# Altium project Button-Board_v2.0.PrjPcb (part 1 of 2)
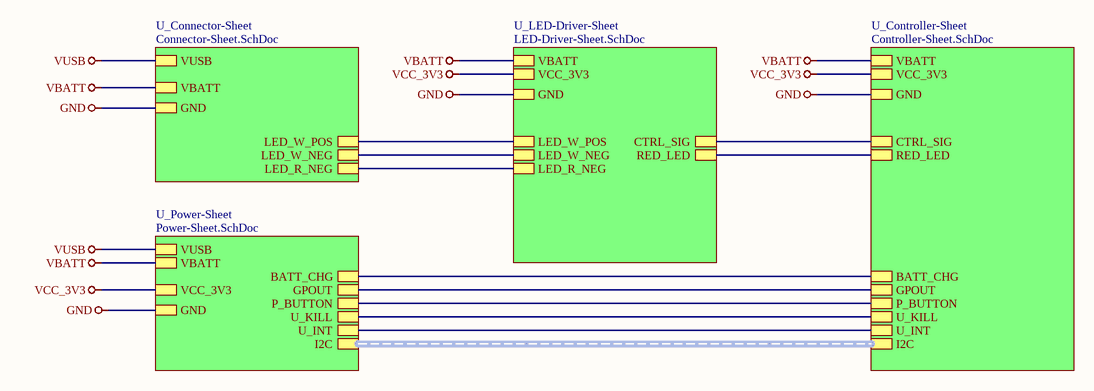
[diagram p0: Top-Sheet.SchDoc]
5 sheets, 55 parts. Net scope: hierarchical (ports join the sheet entries above them; power ports are global).
Board file: PCB_Button_Board_v2.0.PcbDoc
Sheets:
  Top-Sheet.SchDoc
    U_Connector-Sheet = Connector-Sheet.SchDoc
    U_Controller-Sheet = Controller-Sheet.SchDoc
    U_LED-Driver-Sheet = LED-Driver-Sheet.SchDoc
    U_Power-Sheet = Power-Sheet.SchDoc

## Sheet Top-Sheet.SchDoc
size A; DocumentNumber: 1; SheetNumber: 1; SheetTotal: 5

### Sub-sheets
U_Connector-Sheet = Connector-Sheet.SchDoc: VUSB, LED_W_POS, LED_W_NEG, LED_R_NEG, GND, VBATT
U_Controller-Sheet = Controller-Sheet.SchDoc: GND, VCC_3V3, RED_LED, CTRL_SIG, P_BUTTON, I2C (harness I2C), GPOUT, VBATT, U_KILL, U_INT, BATT_CHG
U_LED-Driver-Sheet = LED-Driver-Sheet.SchDoc: GND, VCC_3V3, RED_LED, CTRL_SIG, VBATT, LED_W_POS, LED_W_NEG, LED_R_NEG
U_Power-Sheet = Power-Sheet.SchDoc: GND, VCC_3V3, VUSB, VBATT, I2C (harness I2C), GPOUT, P_BUTTON, U_KILL, U_INT, BATT_CHG

### Nets
GND: sheet U_Connector-Sheet/GND, sheet U_Controller-Sheet/GND, sheet U_LED-Driver-Sheet/GND, sheet U_Power-Sheet/GND
VBATT: sheet U_Connector-Sheet/VBATT, sheet U_Controller-Sheet/VBATT, sheet U_LED-Driver-Sheet/VBATT, sheet U_Power-Sheet/VBATT
VCC_3V3: sheet U_Controller-Sheet/VCC_3V3, sheet U_LED-Driver-Sheet/VCC_3V3, sheet U_Power-Sheet/VCC_3V3
VUSB: sheet U_Connector-Sheet/VUSB, sheet U_Power-Sheet/VUSB
BATT_CHG: sheet U_Controller-Sheet/BATT_CHG, sheet U_Power-Sheet/BATT_CHG
CTRL_SIG: sheet U_Controller-Sheet/CTRL_SIG, sheet U_LED-Driver-Sheet/CTRL_SIG
GPOUT: sheet U_Controller-Sheet/GPOUT, sheet U_Power-Sheet/GPOUT
LED_R_NEG: sheet U_Connector-Sheet/LED_R_NEG, sheet U_LED-Driver-Sheet/LED_R_NEG
LED_W_NEG: sheet U_Connector-Sheet/LED_W_NEG, sheet U_LED-Driver-Sheet/LED_W_NEG
LED_W_POS: sheet U_Connector-Sheet/LED_W_POS, sheet U_LED-Driver-Sheet/LED_W_POS
P_BUTTON: sheet U_Controller-Sheet/P_BUTTON, sheet U_Power-Sheet/P_BUTTON
RED_LED: sheet U_Controller-Sheet/RED_LED, sheet U_LED-Driver-Sheet/RED_LED
U_INT: sheet U_Controller-Sheet/U_INT, sheet U_Power-Sheet/U_INT
U_KILL: sheet U_Controller-Sheet/U_KILL, sheet U_Power-Sheet/U_KILL

### Buses and harness runs
harness sheet U_Controller-Sheet/I2C = sheet U_Power-Sheet/I2C

## Sheet Connector-Sheet.SchDoc
size A4; DocumentNumber: 5; SheetNumber: 5; SheetTotal: 5
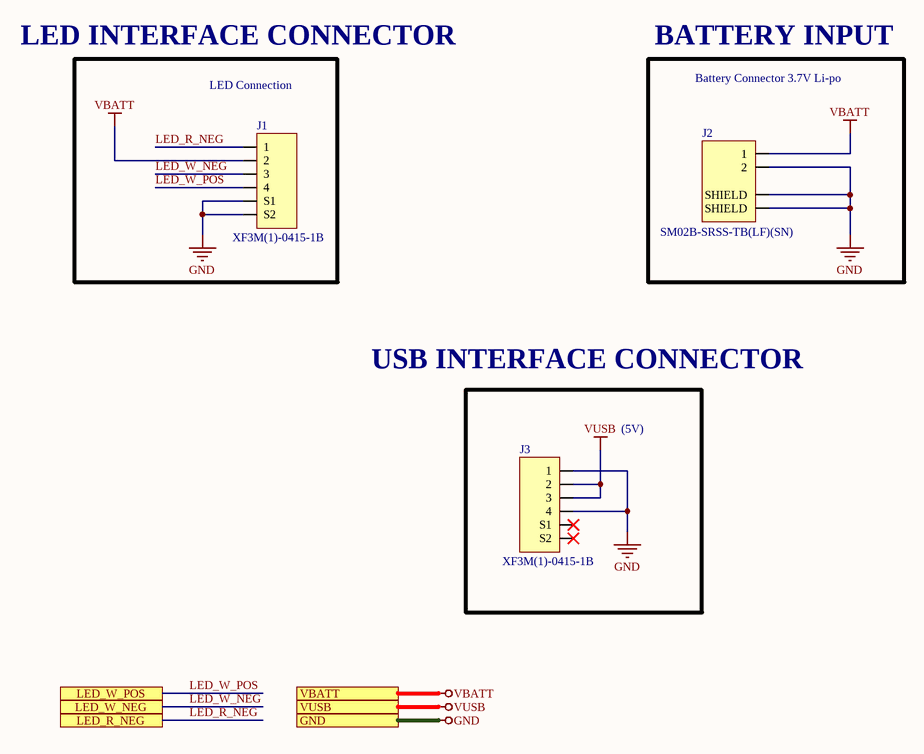
[diagram p1: Connector-Sheet.SchDoc]

### Parts
J1  XF3M(1)-0415-1B  [XF3M(1)-0415-1B]
J2  SM02B-SRSS-TB(LF)(SN)  [SM02B-SRSS-TB(LF)(SN)]
J3  XF3M(1)-0415-1B  [XF3M(1)-0415-1B]

### Blocks framed on the sheet
LED Connection: J1
BATTERY INPUT: J2
(5V): J3

### Ports
GND (see Top-Sheet[1B], Controller-Sheet[2D], LED-Driver-Sheet[2D], Power-Sheet[4C]), LED_R_NEG (see Top-Sheet[2B], LED-Driver-Sheet[1D]), LED_W_NEG (see Top-Sheet[2B], LED-Driver-Sheet[1D]), LED_W_POS (see Top-Sheet[2B], LED-Driver-Sheet[1D]), VBATT (see Top-Sheet[1A], Controller-Sheet[2D], LED-Driver-Sheet[2D], Power-Sheet[4C]), VUSB (see Top-Sheet[1A], Power-Sheet[4C])

### Nets
GND: J2.2 J2.3(SHIELD) J2.4(SHIELD) J3.1 J3.4 ; port GND
VBATT: J1.2 J2.1 ; port VBATT
VUSB: J3.2 J3.3 ; port VUSB
LED_R_NEG: J1.1 ; port LED_R_NEG
LED_W_NEG: J1.3 ; port LED_W_NEG
LED_W_POS: J1.4 ; port LED_W_POS

Not connected (* = marked no-connect by the designer): J1 S1 S2; J3 S1* S2*

### Notes on the sheet
- LED INTERFACE CONNECTOR
- Battery Connector 3.7V Li-po
- USB INTERFACE CONNECTOR
- File:
- Title:
- Date:
- Page
- Num:
- Total:
- Drawn By: Huzaifa Ali

### Library data of the parts
J1 J3 = XF3M(1)-0415-1B: 4 Position FFC, FPC Connector Contacts, Top and Bottom 0.039" (1.00mm) Surface Mount, Right Angle; Manufacturer: Omron Electronics Inc-EMC Div; Item Type: FPC-1mm; Manufacturer Part Number: XF3M(1)-0415-1B; Digikey Part Number: OR1210CT-ND; ComponentLink1Description: Digikey Link; ComponentLink1URL: https://www.digikey.com/en/products/detail/omron-electronics-inc-emc-div/XF3M-1-0415-1B/4695932; Package: 1mm FPC
J2 = SM02B-SRSS-TB(LF)(SN): Connector Header Surface Mount, Right Angle 2 position 0.039 _1.00mm_; Manufacturer Part NUmber: SM02B-SRSS-TB_LF__SN_; Manufacturer: JST Sales; SnapEDA_Link: https://www.snapeda.com/parts/SM02B-SRSS-TB%28LF%29%28SN%29/JST%20Sales%20America%20Inc./view-part/447499/?ref=snap; Price: None; Value: *; Availability: Unavailable; Package: None; Digikey Part Number: 455-SM02B-SRSS-TBDKR-ND; ComponentLink1Description: Digikey Link; ComponentLink1URL: https://www.digikey.com/en/products/detail/jst-sales-america-inc/SM02B-SRSS-TB/926708?s=N4IgTCBcDaIMoFkAMYBCBaOAlOd0BVUQBdAXyA

## Sheet Controller-Sheet.SchDoc
size A4; DocumentNumber: 3; SheetNumber: 3; SheetTotal: 5
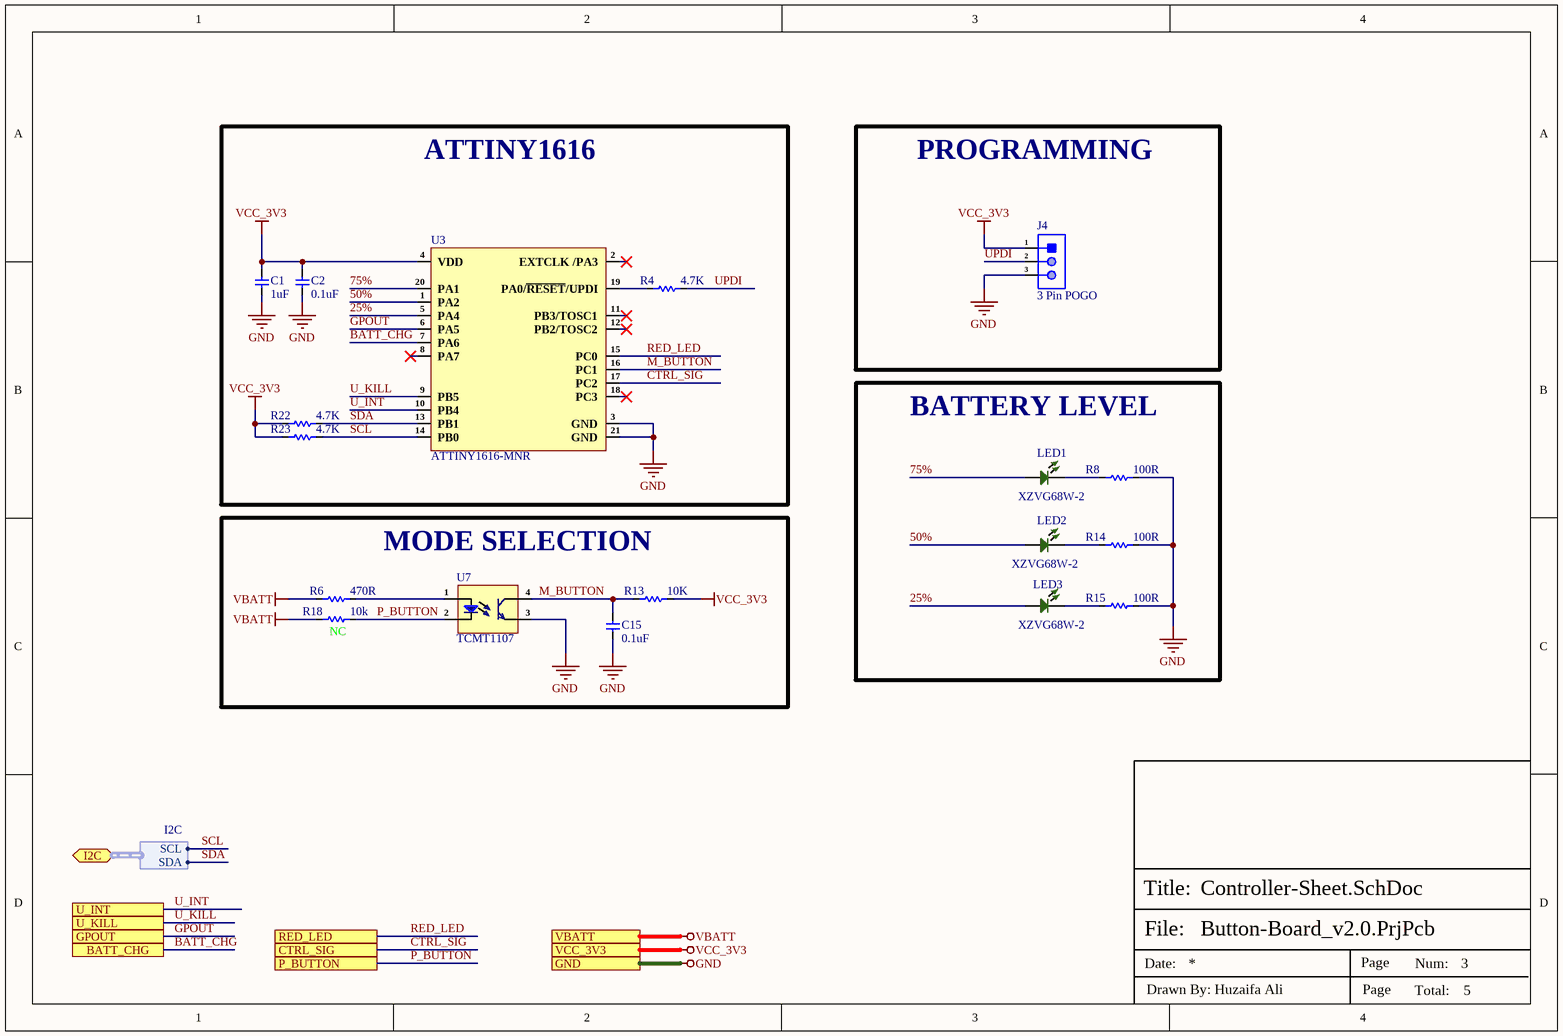
[diagram p2: Controller-Sheet.SchDoc]

### Parts
C1  1uF  [Cap-0402]
C2  0.1uF  [Cap-0402]
C15  0.1uF  [Cap-0402]
J4  3 Pin POGO  [3 Pin POGO]
LED1  XZVG68W-2  [LED-0402]
LED2  XZVG68W-2  [LED-0402]
LED3  XZVG68W-2  [LED-0402]
R4  4.7K  [Res-0402]
R6  470R  [Res-0402]
R8  100R  [Res-0402]
R13  10K  [Res-0402]
R14  100R  [Res-0402]
R15  100R  [Res-0402]
R18  NC  [Res-0402]
R22  4.7K  [Res-0201]
R23  4.7K  [Res-0201]
U3  ATTINY1616-MNR  [20-VQFN (3x3)]
U7  TCMT1107  [SOP-4-1.27mm pitch Body 2.6mm]

### Blocks framed on the sheet
ATTINY1616: C1 C2 R4 R22 R23 U3
PROGRAMMING: J4
BATTERY LEVEL: LED1-LED3 R8 R14 R15
MODE SELECTION: C15 R6 R13 R18 U7

### Ports
BATT_CHG (see Top-Sheet[3B], Power-Sheet[4C]), CTRL_SIG (see Top-Sheet[3B], LED-Driver-Sheet[1D]), GND (see Top-Sheet[3A], Connector-Sheet[2D], LED-Driver-Sheet[2D], Power-Sheet[4C]), GPOUT (see Top-Sheet[3B], Power-Sheet[4C]), I2C (bidir, harness I2C, see Top-Sheet[3B], Power-Sheet[4C]), P_BUTTON (see Top-Sheet[3B], Power-Sheet[4C]), RED_LED (see Top-Sheet[3B], LED-Driver-Sheet[1D]), U_INT (see Top-Sheet[3B], Power-Sheet[4C]), U_KILL (see Top-Sheet[3B], Power-Sheet[4C]), VBATT (see Top-Sheet[3A], Connector-Sheet[2D], LED-Driver-Sheet[2D], Power-Sheet[4C]), VCC_3V3 (see Top-Sheet[3A], LED-Driver-Sheet[2D], Power-Sheet[4C])

### Harnesses
I2C: SDA, SCL

### Nets
GND: C1.1 C2.1 C15.1 J4.3 R8.2 R14.2 R15.2 U3.3(GND) U3.21(GND) U7.3(E) ; port GND
VBATT: R6.1 R18.1 ; port VBATT
VCC_3V3: C1.2 C2.2 J4.1 R13.2 R22.1 R23.1 U3.4(VDD) ; port VCC_3V3
25%: LED3.1 U3.5(PA4)
50%: LED2.1 U3.1(PA2)
75%: LED1.1 U3.20(PA1)
BATT_CHG: U3.7(PA6) ; port BATT_CHG
CTRL_SIG: U3.17(PC2) ; port CTRL_SIG
GPOUT: U3.6(PA5) ; port GPOUT
M_BUTTON: C15.2 R13.1 U3.16(PC1) U7.4(C)
P_BUTTON: R18.2 U7.2(Ca) ; port P_BUTTON
RED_LED: U3.15(PC0) ; port RED_LED
SCL: R23.2 U3.14(PB0) ; port I2C.SCL
SDA: R22.2 U3.13(PB1) ; port I2C.SDA
U_INT: U3.10(PB4) ; port U_INT
U_KILL: U3.9(PB5) ; port U_KILL
UPDI: J4.2 R4.2
NetLED1_2: LED1.2 R8.1
NetLED2_2: LED2.2 R14.1
NetLED3_2: LED3.2 R15.1
NetR4_1: R4.1 U3.19(PA0/~{RESET}/UPDI)
NetR6_2: R6.2 U7.1(An)

Not connected (* = marked no-connect by the designer): U3 2(EXTCLK_/PA3)* 8(PA7)* 11(PB3/TOSC1)* 12(PB2/TOSC2)* 18(PC3)*

### Notes on the sheet
- (near R18) 10k
- File:
- Title:
- Date:
- Page
- Num:
- Total:
- Drawn By: Huzaifa Ali

### Library data of the parts
C1 = GRM033R60J105MEA2D: 1 µF ±20% 6.3V Ceramic Capacitor X5R 0201 (0603 Metric); Manufacturer: Murata Electronics; Manufacturer Part Number: GRM033R60J105MEA2D; Digikey Part Number: 490-7229-6-ND; Item Type: Capacitor; Package: 0201; ComponentLink1Description: Digikey Link; ComponentLink1URL: https://www.digikey.com/en/products/detail/murata-electronics/GRM033R60J105MEA2D/4213369
C2 = GRM155R71C104KA88J: 0.1 µF ±10% 16V Ceramic Capacitor X7R 0402 (1005 Metric); Manufacturer: Murata Electronics; Manufacturer Part Number: GRM155R71C104KA88J; Digikey Part Number: 490-6328-6-ND; Item Type: Capacitor; Package: 0402; ComponentLink1Description: Digikey Link; ComponentLink1URL: https://www.digikey.com/en/products/detail/murata-electronics/GRM155R71C104KA88J/2610892
C15 = GRM155R71C104KA88D: CAP CER 0.1UF 16V X7R 0402; Manufacturer: Murata; Material: Ceramic; Value: 100nF; Tolerance: 10%; Insulation Resistance: 10GR; Item Type: Capacitor; Supplier 1: Arrow Electronics; Manufacturer Part Number: GRM155R71C104KA88D; RoHS: Yes; Category: Ceramic Capacitors; Stock 1: 1690322; Pricing 1: 10000=0.00480, 30000=0.00470, 100000=0.00350, 250000=0.00330 (USD); Mounting Technology: Surface Mount; Case/Package: 0402; Pins: 2; Case Code (Metric): 1005; Case Code (Imperial): 0402; Dielectric Material: Ceramic; Min Operating Temperature: -55°C; Max Operating Temperature: 125°C; Voltage Rating: 16V; Packaging: Tape and Reel; Voltage Rating (DC): 16V; Package Quantity: 1; Dielectric: X7R; Termination: SMD/SMT; Voltage: 16V; Series: GRM; Length: 1mm; Width: 0.02inch; Height: 0.5mm; Thickness: 0.022inch; Depth: 0.5mm; Radiation Hardening: No; Lead Free: Lead Free; RoHS Compliant: Yes; ComponentLink1URL: https://datasheet.ciiva.com/129/grm155r71c104ka88-01-129739.pdf?src-supplier=Digi-Key; ComponentLink1Description: https://datasheet.ciiva.com/129/grm155r71c104ka88-01-129739.pdf?src-supplier=Digi-Key; ComponentLink2URL: https://datasheet.ciiva.com/129/grm155r71c104ka88-01-129740.pdf?src-supplier=Digi-Key; ComponentLink2Description: https://datasheet.ciiva.com/129/grm155r71c104ka88-01-129740.pdf?src-supplier=Digi-Key; ComponentLink3URL: https://datasheet.ciiva.com/18102/getdatasheetpartid-85307-18102905.pdf?src-supplier=Verical; ComponentLink3Description: https://datasheet.ciiva.com/18102/getdatasheetpartid-85307-18102905.pdf?src-supplier=Verical; ComponentLink4URL: https://datasheet.ciiva.com/29199/454098-da-01-en-vs-kondensator-0402-29199799.pdf?src-supplier=Conrad; ComponentLink4Description: https://datasheet.ciiva.com/29199/454098-da-01-en-vs-kondensator-0402-29199799.pdf?src-supplier=Conrad; ComponentLink5URL: https://datasheet.ciiva.com/7937/4360-7937615.pdf?src-supplier=Element14; ComponentLink5Description: https://datasheet.ciiva.com/7937/4360-7937615.pdf?src-supplier=Element14; ComponentLink6URL: https://datasheet.ciiva.com/14116/grmseries-highdielectrictype-eng-14116878.pdf?src-supplier=Distrelec; ComponentLink6Description: https://datasheet.ciiva.com/14116/grmseries-highdielectrictype-eng-14116878.pdf?src-supplier=Distrelec; ComponentLink7URL: https://datasheet.ciiva.com/14103/grmseries-highdielectrictype-eng-14103750.pdf?src-supplier=Distrelec; ComponentLink7Description: https://datasheet.ciiva.com/14103/grmseries-highdielectrictype-eng-14103750.pdf?src-supplier=Distrelec; ComponentLink8URL: https://datasheet.ciiva.com/28534/4360-28534127.pdf?src-supplier=Element14; ComponentLink8Description: https://datasheet.ciiva.com/28534/4360-28534127.pdf?src-supplier=Element14; ComponentLink9URL: https://datasheet.ciiva.com/28534/4360-28534133.pdf?src-supplier=Element14; ComponentLink9Description: https://datasheet.ciiva.com/28534/4360-28534133.pdf?src-supplier=Element14; ComponentLink10URL: https://datasheet.ciiva.com/16199/product-16199000.pdf?src-supplier=Future+Electronics; ComponentLink10Description: https://datasheet.ciiva.com/16199/product-16199000.pdf?src-supplier=Future+Electronics; Supplier Part Number 1: GRM155R71C104KA88D; LCSC Part Number: C71629
J4 = 68000-103HLF: CONN HEADER VERT 3POS 2.54MM; Item Type: Male Header; Number of Positions: 3; Current Rating: 3A; Insulation Resistance: 5GR; Voltage Rating: 1.5kV; Contact Post Length: 2.41mm; LCSC Part Number: C168677; ComponentLink1Description: LCSC; Supplier: Avnet; Supplier Part Number: 88K1775; RoHS: No; Category: Headers and Wire Housings; Stock: 2805; Pricing: 1=0.395, 10=0.31, 25=0.29, 50=0.27, 100=0.25 (USD); Contact Plating: Gold,GXT; Contact Material: Bronze; Housing Material: Thermoplastic; Housing Color: Black; Min Operating Temperature: -65°C; Max Operating Temperature: 125°C; Number of Rows: 1; Termination: Through Hole; Packaging: Bulk; Number of Contacts: 3; Contact Gender: Male; Orientation: Straight; Max Voltage Rating (AC): 1.5kV; Package Quantity: 100; Series: 68000; Length: 7.62mm; Pitch: 2.54mm; Contact Mating Length: 5.84mm; Depth: 2.41mm; Radiation Hardening: No; Flammability Rating: UL94 V-0; Reach SVHC Compliant: No; ComponentLink2URL: https://datasheet.ciiva.com/46392/1914865-46392021.pdf?src-supplier=Element14; ComponentLink2Description: https://datasheet.ciiva.com/46392/1914865-46392021.pdf?src-supplier=Element14; Digikey Part Number: 609-3461-ND; ComponentLink3Description: Digikey Link; ComponentLink3URL: https://www.digikey.com/en/products/detail/amphenol-cs-fci/68000-103HLF/2023309?s=N4IgTCBcDaIGwA4AMKC0BGJBmAEgGQDEQBdAXyA; Manufacturer Part Number: 68000-103HLF
LED1-LED3 = XZVG68W-2: LED GREEN CLEAR CHIP SMD; Manufacturer: SunLED; Lens Color: Colorless; Luminous Intensity: 49mcd; Test Current: 20mA; Viewing Angle: 120°; Dominant Wavelength: 570nm; Forward Voltage: 2.1V; Supplier 1: Digi-Key; Manufacturer Part Number: XZVG68W-2; Stock 1: 4185; Pricing 1: 1=0.5, 10=0.36, 100=0.16, 500=0.112, 1000=0.092 (USD); Mount: Surface Mount; Case/Package: 0402; Color: Green; Case Code (Metric): 1005; Case Code (Imperial): 0402; Packaging: Tape and Reel; Lens Transparency: Clear; Length: 1mm; Height: 0.6mm; Width: 0.5mm; ComponentLink1URL: http://www.sunledusa.com/products/spec/XZVG68W-2.pdf?src-supplier=Digi-Key; ComponentLink1Description: http://www.sunledusa.com/products/spec/XZVG68W-2.pdf?src-supplier=Digi-Key; ComponentLink2URL: https://www.sunledusa.com/products/spec/XZVG68W-2.pdf?src-supplier=Digi-Key; ComponentLink2Description: https://www.sunledusa.com/products/spec/XZVG68W-2.pdf?src-supplier=Digi-Key; Supplier Part Number 1: 1497-1219-6-ND; Item Type: LED
R4 = RC0402FR-074K7L: 4.7 kOhms ±1% 0.063W, 1/16W Chip Resistor 0402 (1005 Metric) Moisture Resistant Thick Film; Manufacturer: YAGEO; Manufacturer Part Number: RC0402FR-074K7L; Digikey Part Number: 311-4.7KLRDKR-ND; Item Type: Resistor; Package: 0402; ComponentLink1Description: Digikey Link; ComponentLink1URL: https://www.digikey.com/en/products/detail/yageo/RC0402FR-074K7L/2827563
R6 = RC0402FR-07470RL: RES 470 OHM 1% 1/16W 0402; Manufacturer: Yageo; Item Type: Resistor; Voltage Rating: 50V; Power Rating: 62.5mW; Temperature Coefficient: 100ppm/°C; Max Power Dissipation: 63mW; Supplier: Avnet; Supplier Part Number: RC0402FR-07470RL; Manufacturer Part Number: RC0402FR-07470RL; RoHS: Yes; Stock: 10000; Pricing: 10000=0.00085 (USD); Case/Package: 0402; Case Code (Metric): 1005; Case Code (Imperial): 0402; Min Operating Temperature: -55°C; Max Operating Temperature: 155°C; Packaging: Tape and Reel; Value: 470R; Tolerance: 1%; Number of Terminations: 2; Working Voltage: 50V; Package Quantity: 1; Resistor Type: Thick Film; Termination: SMD/SMT; Features: Moisture Resistant; Series: RC; Resistance Tolerance: 1%; Construction: Rectangular; Voltage Rating (AC): 50V; Length: 1mm; Width: 0.02inch; Height: 0.016inch; Depth: 0.5mm; Lead Free: Lead Free; Reach SVHC Compliant: No; RoHS Compliant: Yes; Military Standard: Not; ComponentLink1URL: https://datasheet.ciiva.com/46412/1018594-46412838.pdf?src-supplier=Element14; ComponentLink1Description: https://datasheet.ciiva.com/46412/1018594-46412838.pdf?src-supplier=Element14; ComponentLink2URL: https://datasheet.ciiva.com/2453/pyu-r-int-thick-7-2453377.pdf?src-supplier=Digikey; ComponentLink2Description: https://datasheet.ciiva.com/2453/pyu-r-int-thick-7-2453377.pdf?src-supplier=Digikey; ComponentLink3URL: https://datasheet.ciiva.com/2453/pyu-r-int-thick-7-2453378.pdf?src-supplier=Digikey; ComponentLink3Description: https://datasheet.ciiva.com/2453/pyu-r-int-thick-7-2453378.pdf?src-supplier=Digikey; ComponentLink4URL: https://datasheet.ciiva.com/2453/pyu-r-int-thick-7-2453376.pdf?src-supplier=Digikey; ComponentLink4Description: https://datasheet.ciiva.com/2453/pyu-r-int-thick-7-2453376.pdf?src-supplier=Digikey; ComponentLink5URL: https://datasheet.ciiva.com/7850/1018594-7850015.pdf?src-supplier=Element14; ComponentLink5Description: https://datasheet.ciiva.com/7850/1018594-7850015.pdf?src-supplier=Element14; ComponentLink6URL: https://datasheet.ciiva.com/7850/1018594-7850014.pdf?src-supplier=Element14; ComponentLink6Description: https://datasheet.ciiva.com/7850/1018594-7850014.pdf?src-supplier=Element14; ComponentLink7URL: https://datasheet.ciiva.com/15189/getdatasheetpartid-330246-15189463.pdf?src-supplier=Verical; ComponentLink7Description: https://datasheet.ciiva.com/15189/getdatasheetpartid-330246-15189463.pdf?src-supplier=Verical; LCSC Part Number: C114877
R8 R14 R15 = RC0402FR-07100RL: 100 Ohms ±1% 0.063W, 1/16W Chip Resistor 0402 (1005 Metric) Moisture Resistant Thick Film; Manufacturer: YAGEO; Manufacturer Part Number: RC0402FR-07100RL; Digikey Part Number: 311-100LRDKR-ND; Item Type: Resistor; Package: 0402; ComponentLink1Description: Digikey Link; ComponentLink1URL: https://www.digikey.com/en/products/detail/yageo/RC0402FR-07100RL/726527
R13 = RC0402FR-0710KL: RES 10K OHM 1% 1/16W 0402; Manufacturer: Yageo; Resistance: 10kR; Voltage Rating (DC): 50V; Temperature Coefficient: 100ppm/°C; Power Rating: 62.5mW; Max Power Dissipation: 63mW; Item Type: Resistor; Supplier 1: Mouser; Manufacturer Part Number: RC0402FR-0710KL; RoHS: Yes; Category: Chip SMD Resistors; Stock 1: 18648329; Pricing 1: 1=0.10000, 10=0.01400, 50=0.01400, 100=0.00500, 1000=0.00300, 10000=0.00200 (USD); Case/Package: 0402; Number of Pins: 2; Case Code (Imperial): 0402; Case Code (Metric): 1005; Min Operating Temperature: -55°C; Max Operating Temperature: 155°C; Resistor Type: Thick Film; Tolerance: 1%; Packaging: Tape and Reel; Voltage Rating: 50V; Termination: SMD/SMT; Working Voltage: 50V; Number of Terminations: 2; Features: Moisture Resistant; Series: RC; Resistance Tolerance: 1%; Construction: Rectangular; Length: 1mm; Width: 0.5mm; Height: 0.32mm; Depth: 0.5mm; Lead Pitch: 0.2mm; REACH SVHC: No SVHC; Lead Free: Lead Free; RoHS Compliant: Yes; Military Standard: Not; ComponentLink1URL: https://datasheet.ciiva.com/7660/38568-7660787.pdf?src-supplier=Element14; ComponentLink1Description: https://datasheet.ciiva.com/7660/38568-7660787.pdf?src-supplier=Element14; ComponentLink2URL: https://datasheet.ciiva.com/7849/1686128-7849814.pdf?src-supplier=Element14; ComponentLink2Description: https://datasheet.ciiva.com/7849/1686128-7849814.pdf?src-supplier=Element14; ComponentLink3URL: https://datasheet.ciiva.com/7983/1018594-7983486.pdf?src-supplier=Element14; ComponentLink3Description: https://datasheet.ciiva.com/7983/1018594-7983486.pdf?src-supplier=Element14; ComponentLink4URL: https://datasheet.ciiva.com/22747/1018594-22747512.pdf?src-supplier=Element14; ComponentLink4Description: https://datasheet.ciiva.com/22747/1018594-22747512.pdf?src-supplier=Element14; ComponentLink5URL: https://datasheet.ciiva.com/12667/pyu-rc0402-51-rohs-l-6-r-12667067.pdf?src-supplier=Mouser; ComponentLink5Description: https://datasheet.ciiva.com/12667/pyu-rc0402-51-rohs-l-6-r-12667067.pdf?src-supplier=Mouser; ComponentLink6URL: https://datasheet.ciiva.com/7849/1784430-7849813.pdf?src-supplier=Element14; ComponentLink6Description: https://datasheet.ciiva.com/7849/1784430-7849813.pdf?src-supplier=Element14; ComponentLink7URL: https://datasheet.ciiva.com/7849/1784430-7849815.pdf?src-supplier=Element14; ComponentLink7Description: https://datasheet.ciiva.com/7849/1784430-7849815.pdf?src-supplier=Element14; Supplier Part Number 1: 603-RC0402FR-0710KL; LCSC Part Number: C60490
R18 = RT0402BRD0710KL: RES SMD 10K OHM 0.1% 1/16W 0402; Manufacturer: Yageo; Item Type: Resistor; Supplier: Future Electronics; Supplier Part Number: 1236728; Manufacturer Part Number: RT0402BRD0710KL; RoHS: Yes; Category: Chip SMD Resistors; Stock: 490000; Pricing: 10000=0.0218, 20000=0.0213, 30000=0.021, 50000=0.0206, 100000=0.0199 (USD); ComponentLink1URL: https://datasheet.ciiva.com/12836/pyu-rt-1-to-0-05-rohs-l-4-12836454.pdf?src-supplier=Mouser; ComponentLink1Description: https://datasheet.ciiva.com/12836/pyu-rt-1-to-0-05-rohs-l-4-12836454.pdf?src-supplier=Mouser; LCSC Part Number: C190095
R22 R23 = RC0201FR-074K7L: RES 4.7K OHM 1% 1/20W 0201; Manufacturer: Yageo; Item Type: Resistor; Supplier: Future Electronics; Supplier Part Number: 7537285; Manufacturer Part Number: RC0201FR-074K7L; RoHS: Yes; Category: Chip SMD Resistors; Stock: 1610000; Pricing: 10000=0.0014, 50000=0.0013, 250000=0.0013, 750000=0.0012, 2000000=0.0011 (USD); ComponentLink1URL: https://datasheet.ciiva.com/2493/pyu-r-int-thick-7-2493811.pdf?src-supplier=Digi-Key; ComponentLink1Description: https://datasheet.ciiva.com/2493/pyu-r-int-thick-7-2493811.pdf?src-supplier=Digi-Key; ComponentLink2URL: https://datasheet.ciiva.com/2493/pyu-r-int-thick-7-2493812.pdf?src-supplier=Digi-Key; ComponentLink2Description: https://datasheet.ciiva.com/2493/pyu-r-int-thick-7-2493812.pdf?src-supplier=Digi-Key; ComponentLink3URL: https://datasheet.ciiva.com/2493/pyu-r-int-thick-7-2493813.pdf?src-supplier=Digi-Key; ComponentLink3Description: https://datasheet.ciiva.com/2493/pyu-r-int-thick-7-2493813.pdf?src-supplier=Digi-Key; ComponentLink4URL: https://datasheet.ciiva.com/8892/pyu-rc0201-51-rohs-l-8-8892942.pdf?src-supplier=Avnet; ComponentLink4Description: https://datasheet.ciiva.com/8892/pyu-rc0201-51-rohs-l-8-8892942.pdf?src-supplier=Avnet; ComponentLink5URL: https://datasheet.ciiva.com/7672/1563626-7672233.pdf?src-supplier=Element14; ComponentLink5Description: https://datasheet.ciiva.com/7672/1563626-7672233.pdf?src-supplier=Element14; LCSC Part Number: C138135
U3 = ATTINY1616-MNR: AVR tinyAVR™ 1, Functional Safety (FuSa) Microcontroller IC 8-Bit 20MHz 16KB (16K x 8) FLASH 20-VQFN (3x3); Manufacturer: Microchip Tech; Manufacturer Part Number: ATTINY1616-MNR; Package: QFN-20-EP(3x3); Digikey Part Number: ATTINY1616-MNRDKR-ND; Item Type: IC; ComponentLink1URL: https://www.digikey.com/en/products/detail/microchip-technology/ATTINY1616-MNR/7354618?s=N4IgTCBcDaIIIBUEEkByBNAjANhwWgFlUAlEAXQF8g; ComponentLink1Description: Digikey Link
U7 = TCMT1107: OPTOISOLATOR 3.75KV TRANS 4-SOP; Manufacturer: Vishay Semiconductors; Item Type: Optocouplers; Voltage Rating (DC): 70V; Turn-Off Delay Time: 4us; Turn-On Delay Time: 1.5us; Supplier: Mouser; LCSC Part Number: C81148; Manufacturer Part Number: TCMT1107; RoHS: Yes; Stock: 27846; Pricing: 1=0.6, 10=0.386, 50=0.386, 100=0.26, 1000=0.203, 10000=0.163 (USD); Height: 2.3mm; Lead Free: 5697LeadFree; RoHS Compliant: 5897YesNo; ComponentLink1URL: https://datasheet.ciiva.com/11772/0900766b80e30939-11772485.pdf?src-supplier=Rs; ComponentLink1Description: https://datasheet.ciiva.com/11772/0900766b80e30939-11772485.pdf?src-supplier=Rs; ComponentLink2URL: https://datasheet.ciiva.com/27051/1107109-27051440.pdf?src-supplier=Jameco; ComponentLink2Description: https://datasheet.ciiva.com/27051/1107109-27051440.pdf?src-supplier=Jameco; ComponentLink3URL: https://datasheet.ciiva.com/8040/485045-8040879.pdf?src-supplier=Element14; ComponentLink3Description: https://datasheet.ciiva.com/8040/485045-8040879.pdf?src-supplier=Element14; ComponentLink4URL: https://datasheet.ciiva.com/14079/tcmt1100-14079945.pdf?src-supplier=Digikey; ComponentLink4Description: https://datasheet.ciiva.com/14079/tcmt1100-14079945.pdf?src-supplier=Digikey; ComponentLink5URL: https://datasheet.ciiva.com/14079/tcmt1100-14079946.pdf?src-supplier=Digikey; ComponentLink5Description: https://datasheet.ciiva.com/14079/tcmt1100-14079946.pdf?src-supplier=Digikey; ComponentLink6URL: https://datasheet.ciiva.com/8092/tcmt1100-8092285.pdf?src-supplier=Avnet; ComponentLink6Description: https://datasheet.ciiva.com/8092/tcmt1100-8092285.pdf?src-supplier=Avnet; ComponentLink7URL: https://datasheet.ciiva.com/12088/tcmt1100-103040-12088638.pdf?src-supplier=Mouser; ComponentLink7Description: https://datasheet.ciiva.com/12088/tcmt1100-103040-12088638.pdf?src-supplier=Mouser

## Sheet LED-Driver-Sheet.SchDoc
size A4; DocumentNumber: 4; SheetNumber: 4; SheetTotal: 5
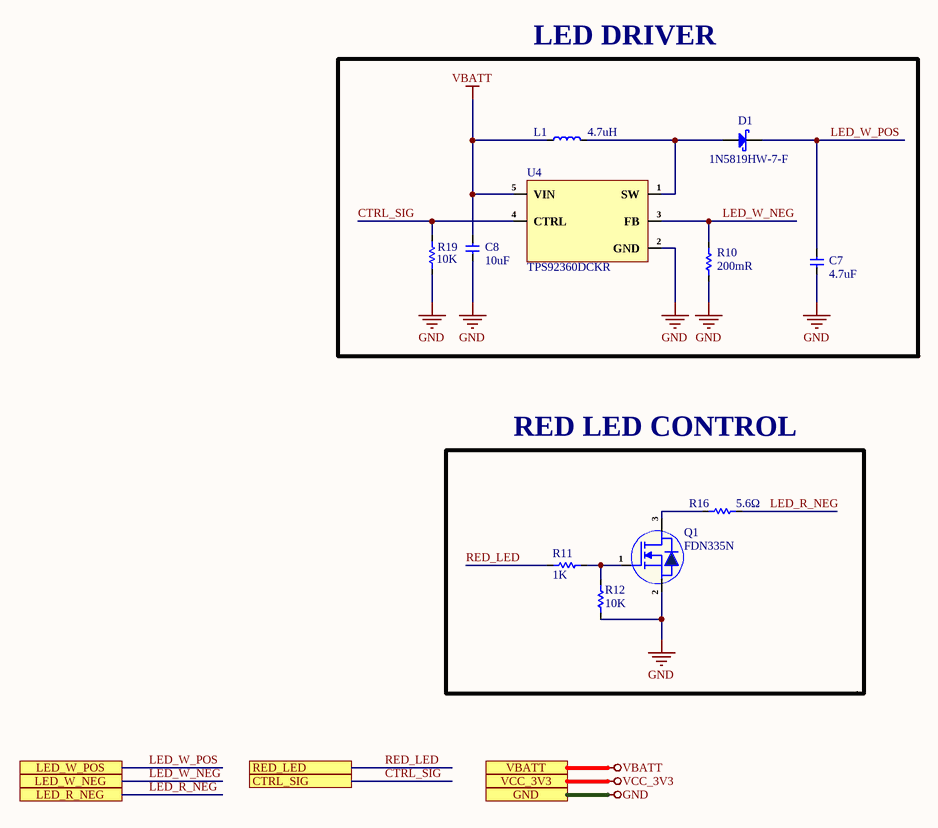
[diagram p3: LED-Driver-Sheet.SchDoc]

### Parts
C7  4.7uF  [Cap-0402]
C8  10uF  [Cap-0402]
D1  1N5819HW-7-F  [SOD-123]
L1  4.7uH  [IND-1210_]
Q1  FDN335N  [SOT-23]
R10  200mR  [Res-1206]
R11  1K  [Res-0402]
R12  10K  [Res-0402]
R16  5.6Ω  [Res-1206]
R19  10K  [Res-0402]
U4  TPS92360DCKR  [SC70-5]

### Blocks framed on the sheet
LED DRIVER: C7 C8 D1 L1 R10 R19 U4
RED LED CONTROL: Q1 R11 R12 R16

### Ports
CTRL_SIG (see Top-Sheet[3B], Controller-Sheet[1D]), GND (see Top-Sheet[2A], Connector-Sheet[2D], Controller-Sheet[2D], Power-Sheet[4C]), LED_R_NEG (see Top-Sheet[2B], Connector-Sheet[1D]), LED_W_NEG (see Top-Sheet[2B], Connector-Sheet[1D]), LED_W_POS (see Top-Sheet[2B], Connector-Sheet[1D]), RED_LED (see Top-Sheet[3B], Controller-Sheet[1D]), VBATT (see Top-Sheet[2A], Connector-Sheet[2D], Controller-Sheet[2D], Power-Sheet[4C]), VCC_3V3 (see Top-Sheet[2A], Controller-Sheet[2D], Power-Sheet[4C])

### Nets
GND: C7.1 C8.1 Q1.2(S) R10.1 R12.2 R19.1 U4.2(GND) ; port GND
VBATT: C8.2 L1.1 U4.5(VIN) ; port VBATT
CTRL_SIG: R19.2 U4.4(CTRL) ; port CTRL_SIG
LED_R_NEG: R16.2 ; port LED_R_NEG
LED_W_NEG: R10.2 U4.3(FB) ; port LED_W_NEG
LED_W_POS: C7.2 D1.2(K) ; port LED_W_POS
RED_LED: R11.1 ; port RED_LED
NetD1_1: D1.1(A) L1.2 U4.1(SW)
NetQ1_1: Q1.1(G) R11.2 R12.1
NetQ1_3: Q1.3(D) R16.1

### Notes on the sheet
- File:
- Title:
- Date:
- Page
- Num:
- Total:
- Drawn By: Huzaifa Ali

### Library data of the parts
C7 = CL05A475MO5NUNC: CAP CER 4.7UF 16V X5R 0402; Manufacturer: Samsung; Material: 4241ConductorMaterial; Tolerance: 20%; Supplier 1: Avnet; Manufacturer Part Number: CL05A475MO5NUNC; RoHS: Yes; Category: Ceramic Capacitors; Stock 1: 50000; Pricing 1: 10000=0.09712 (USD); Mount: Surface Mount; Case/Package: 0402; Case Code (Metric): 1005; Case Code (Imperial): 0402; Min Operating Temperature: -55°C; Max Operating Temperature: 85°C; Packaging: Cut Tape; Capacitance: 4.7uF; Voltage Rating: 16V; Series: CL; Voltage Rating (DC): 16V; Length: 0.039inch; Width: 0.02inch; Height: 550um; Thickness: 0.022inch; RoHS Compliant: Yes; ComponentLink1URL: http://www.farnell.com/datasheets/2710653.pdf?src-supplier=Farnell; ComponentLink1Description: http://www.farnell.com/datasheets/2710653.pdf?src-supplier=Farnell; ComponentLink2URL: http://www.samsungsem.com/kr/support/product-search/mlcc/CL05A475MO5NUNC.jsp?src-supplier=Digikey; ComponentLink2Description: http://www.samsungsem.com/kr/support/product-search/mlcc/CL05A475MO5NUNC.jsp?src-supplier=Digikey; ComponentLink3URL: http://www.farnell.com/datasheets/2710653.pdf?src-supplier=Element14; ComponentLink3Description: http://www.farnell.com/datasheets/2710653.pdf?src-supplier=Element14; ComponentLink4URL: https://datasheet.octopart.com/CL05A475MO5NUNC-Samsung-Electro-Mechanics-datasheet-123102911.pdf?src-supplier=Future+Electronics; ComponentLink4Description: https://datasheet.octopart.com/CL05A475MO5NUNC-Samsung-Electro-Mechanics-datasheet-123102911.pdf?src-supplier=Future+Electronics; ComponentLink5URL: http://www.farnell.com/datasheets/2710653.pdf?src-supplier=Newark; ComponentLink5Description: http://www.farnell.com/datasheets/2710653.pdf?src-supplier=Newark; Supplier Part Number 1: CL05A475MO5NUNC
C8 = CL05A106MP5NUNC: CAP CER 10UF 10V X5R 0402; Manufacturer: Samsung; Tolerance: 20%; Item Type: Capacitor; Supplier 1: Avnet; Manufacturer Part Number: CL05A106MP5NUNC; RoHS: Yes; Category: Ceramic Capacitors; Stock 1: 1729850; Pricing 1: 10000=0.02537 (USD); Mount: Surface Mount; Case/Package: 0402; Case Code (Metric): 1005; Case Code (Imperial): 0402; Contact Plating: Tin; Min Operating Temperature: -55°C; Max Operating Temperature: 85°C; Package Quantity: 1; Packaging: Tape and Reel; Capacitance: 10uF; Voltage Rating: 10V; Dielectric: X5R; Termination: Wraparound; Series: CL; Construction: Flat; Length: 1mm; Width: 0.02inch; Thickness: 0.028inch; Depth: 0.5mm; Radiation Hardening: No; Lead Free: Lead Free; RoHS Compliant: Yes; ComponentLink1URL: https://datasheet.ciiva.com/25721/cl05a106mp5nunc-25721584.pdf?src-supplier=Digi-Key; ComponentLink1Description: https://datasheet.ciiva.com/25721/cl05a106mp5nunc-25721584.pdf?src-supplier=Digi-Key; ComponentLink2URL: https://datasheet.ciiva.com/26838/getdatasheetpartid-745310-26838170.pdf?src-supplier=Verical; ComponentLink2Description: https://datasheet.ciiva.com/26838/getdatasheetpartid-745310-26838170.pdf?src-supplier=Verical; Supplier Part Number 1: CL05A106MP5NUNC; LCSC Part Number: C315248
D1 = 1N5819HW-7-F: DIODE SCHOTTKY 40V 1A SOD123; Manufacturer: Diodes; Forward Voltage: 450mV; Max Reverse Current: 50uA; Element Configuration: Single; Max Forward Surge Current (Ifsm): 25A; Max Power Dissipation: 450mW; Polarity: Standard; Capacitance: 110pF; Supplier 1: Digi-Key; Manufacturer Part Number: 1N5819HW-7-F; RoHS: Yes; Category: Schottky Diodes; Pricing 1: 1=0.46000, 10=0.34500, 100=0.19530, 500=0.12936, 1000=0.09918 (USD); Case/Package: SOD-123-2; Number of Pins: 2; Weight: 0.000353oz; Contact Plating: Tin,Matte; Min Operating Temperature: -65°C; Max Operating Temperature: 125°C; Forward Current: 1A; Max Repetitive Reverse Voltage (Vrrm): 40V; Packaging: Tape and Reel; Peak Non-Repetitive Surge Current: 25A; Package Quantity: 3000; Average Rectified Current: 1A; Termination: SMD/SMT; Voltage Rating (DC): 40V; Current Rating: 1A; Output Current: 1A; Max Reverse Voltage (DC): 40V; Series: -; Length: 2.85mm; Width: 1.7mm; Height: 1.25mm; Radiation Hardening: No; RoHS Compliant: Yes; REACH SVHC: No SVHC; Lead Free: Lead Free; ComponentLink1URL: https://datasheet.ciiva.com/16303/ds30217-16303296.pdf?src-supplier=Future+Electronics; ComponentLink1Description: https://datasheet.ciiva.com/16303/ds30217-16303296.pdf?src-supplier=Future+Electronics; ComponentLink2URL: https://datasheet.ciiva.com/27092/1538419-27092484.pdf?src-supplier=Jameco; ComponentLink2Description: https://datasheet.ciiva.com/27092/1538419-27092484.pdf?src-supplier=Jameco; ComponentLink3URL: https://datasheet.ciiva.com/912/ds30217-912801.pdf?src-supplier=Digi-Key; ComponentLink3Description: https://datasheet.ciiva.com/912/ds30217-912801.pdf?src-supplier=Digi-Key; ComponentLink4URL: https://datasheet.ciiva.com/1177/ds30217-1177089.pdf?src-supplier=Element14; ComponentLink4Description: https://datasheet.ciiva.com/1177/ds30217-1177089.pdf?src-supplier=Element14; ComponentLink5URL: https://datasheet.ciiva.com/912/ds30217-912802.pdf?src-supplier=Digi-Key; ComponentLink5Description: https://datasheet.ciiva.com/912/ds30217-912802.pdf?src-supplier=Digi-Key; ComponentLink6URL: https://datasheet.ciiva.com/912/ds30217-912803.pdf?src-supplier=Digi-Key; ComponentLink6Description: https://datasheet.ciiva.com/912/ds30217-912803.pdf?src-supplier=Digi-Key; ComponentLink7URL: https://datasheet.ciiva.com/8303/ds30217-8303132.pdf?src-supplier=Avnet; ComponentLink7Description: https://datasheet.ciiva.com/8303/ds30217-8303132.pdf?src-supplier=Avnet; ComponentLink8URL: https://datasheet.ciiva.com/25919/ds30217-25919644.pdf?src-supplier=Avnet+Europe; ComponentLink8Description: https://datasheet.ciiva.com/25919/ds30217-25919644.pdf?src-supplier=Avnet+Europe; Supplier Part Number 1: 1N5819HW-FDICT-ND; LCSC Part Number: C82544; Item Type: Diode
L1 = DFE322512F-4R7M=P2: FIXED IND 4.7UH 1.6A 157MOHM SMD; Manufacturer: Murata; Item Type: Inductor; Supplier 1: Digi-Key; Manufacturer Part Number: DFE322512F-4R7M=P2; RoHS: Yes; Category: Fixed Inductors; Stock 1: 4687; Pricing 1: 1=0.61, 10=0.533, 25=0.4952, 50=0.4188, 100=0.3808, 250=0.35792, 500=0.31984, 1000=0.25892 (USD); RoHS Compliant: Yes; Supplier Part Number 1: 490-DFE322512F-4R7M=P2CT-ND; LCSC Part Number: C703083
Q1 = FDN335N: SOT-23 MOSFETs ROHS; Manufacturer: onsemi; Item Type: Mosfet; Manufacturer Part Number: FDN335N; Package: SOT-23; Digikey Part Number: FDN335NDKR-ND; ComponentLink1Description: Digikey Link; ComponentLink1URL: https://www.digikey.com/en/products/detail/onsemi/FDN335N/965301
R10 = PE1206FRF470R2L: RES 0.2 OHM 1% 1W 1206; Manufacturer: Yageo; Item Type: Resistors; Temperature Coefficient: 100ppm/°C; Supplier: Digikey; LCSC Part Number: C723709; Manufacturer Part Number: PE1206FRF470R2L; RoHS: Yes; Stock: 7734; Pricing: 1=0.63, 10=0.459, 25=0.368, 50=0.2732, 100=0.1927, 250=0.17164, 500=0.14714, 1000=0.1121 (USD); Case/Package: 340Case; Packaging: 10Packaging; Value: 200mR; RoHS Compliant: Yes
R11 = RC0402FR-071KL: 1 kOhms ±1% 0.063W, 1/16W Chip Resistor 0402 (1005 Metric) Moisture Resistant Thick Film; Manufacturer: YAGEO; Manufacturer Part Number: RC0402FR-071KL; Digikey Part Number: 311-1.00KLRDKR-ND; Item Type: Resistor; Package: 0402; ComponentLink1Description: Digikey Link; ComponentLink1URL: https://www.digikey.com/en/products/detail/yageo/RC0402FR-071KL/726513
R12 = RC0603FR-0710KL: 10 kOhms ±1% 0.063W, 1/16W Chip Resistor 0402 (1005 Metric) Moisture Resistant Thick Film; Manufacturer: YAGEO; Manufacturer Part Number: RC0402FR-0710KL; Digikey Part Number: 311-10.0KLRDKR-ND; Item Type: Resistor; Package: 0402; ComponentLink1Description: Digikey Link; ComponentLink1URL: https://www.digikey.com/en/products/detail/yageo/RC0402FR-0710KL/726523
R16 = RC1206FR-075R6L: RES 5.6 OHM 1% 1/4W 1206; Manufacturer: Yageo; Item Type: Resistor; Voltage Rating (AC): 200V; Supplier: Future Electronics; LCSC Part Number: C137246; Manufacturer Part Number: RC1206FR-075R6L; RoHS: Yes; Stock: 50000; Pricing: 5000=0.0109, 25000=0.0104, 100000=0.0098, 250000=0.0095, 625000=0.009 (USD); ComponentLink1URL: https://datasheet.ciiva.com/11808/0900766b80c6630a-11808968.pdf?src-supplier=Rs; ComponentLink1Description: https://datasheet.ciiva.com/11808/0900766b80c6630a-11808968.pdf?src-supplier=Rs; ComponentLink2URL: https://datasheet.ciiva.com/7857/444357-7857382.pdf?src-supplier=Element14; ComponentLink2Description: https://datasheet.ciiva.com/7857/444357-7857382.pdf?src-supplier=Element14; ComponentLink3URL: https://datasheet.ciiva.com/7857/444357-7857383.pdf?src-supplier=Element14; ComponentLink3Description: https://datasheet.ciiva.com/7857/444357-7857383.pdf?src-supplier=Element14; ComponentLink4URL: https://datasheet.ciiva.com/17422/pyu-rc1206-51-rohs-l-4-17422485.pdf?src-supplier=Future+Electronics; ComponentLink4Description: https://datasheet.ciiva.com/17422/pyu-rc1206-51-rohs-l-4-17422485.pdf?src-supplier=Future+Electronics
R19 = RT0402BRD0710KL: as R18 on sheet Controller-Sheet; Supplier: Future Electronics; Supplier Part Number: 1236728; Manufacturer Part Number: RT0402BRD0710KL; RoHS: Yes; Category: Chip SMD Resistors; Stock: 490000; Pricing: 10000=0.0218, 20000=0.0213, 30000=0.021, 50000=0.0206, 100000=0.0199 (USD); ComponentLink1URL: https://datasheet.ciiva.com/12836/pyu-rt-1-to-0-05-rohs-l-4-12836454.pdf?src-supplier=Mouser; ComponentLink1Description: https://datasheet.ciiva.com/12836/pyu-rt-1-to-0-05-rohs-l-4-12836454.pdf?src-supplier=Mouser; LCSC Part Number: C190095
U4 = TPS92360DCKR: IC LED DRV RGLTR PWM 1.2A SC70-5; Manufacturer: Texas Instruments; Supplier: Digikey; LCSC Part Number: C2928788; Manufacturer Part Number: TPS92360DCKR; RoHS: No; Item Type: IC; Stock: 4572; Pricing: 1=0.91, 10=0.817, 25=0.7748, 100=0.6366, 250=0.59508, 500=0.52588, 1000=0.41517 (USD)